# Altium schematic sheet P1.schdoc
size 297 x 209 mm; Symbol: Drawing-Symbol_A4; @Create Time: 13:52:45; @Update Time: 20:21:33; Border: 1; Width: 1170; Height: 825; Region Start: 1; X Region Count: 6; Y Region Count: 4; Blade Width: 10; Title Block Position: 3; Title Block: 1; @Board Name: ADC; Company: 嘉立创EDA; Version: V1.0; Page Size: A4; @Project Name: stm32f4; @Page Count: 1; @Update Date: 2025-11-17; @Create Date: 2025-11-02; @Schematic Name: Schematic2; @Page No: 1; @Page Name: P1; Device: Drawing-Symbol_A4
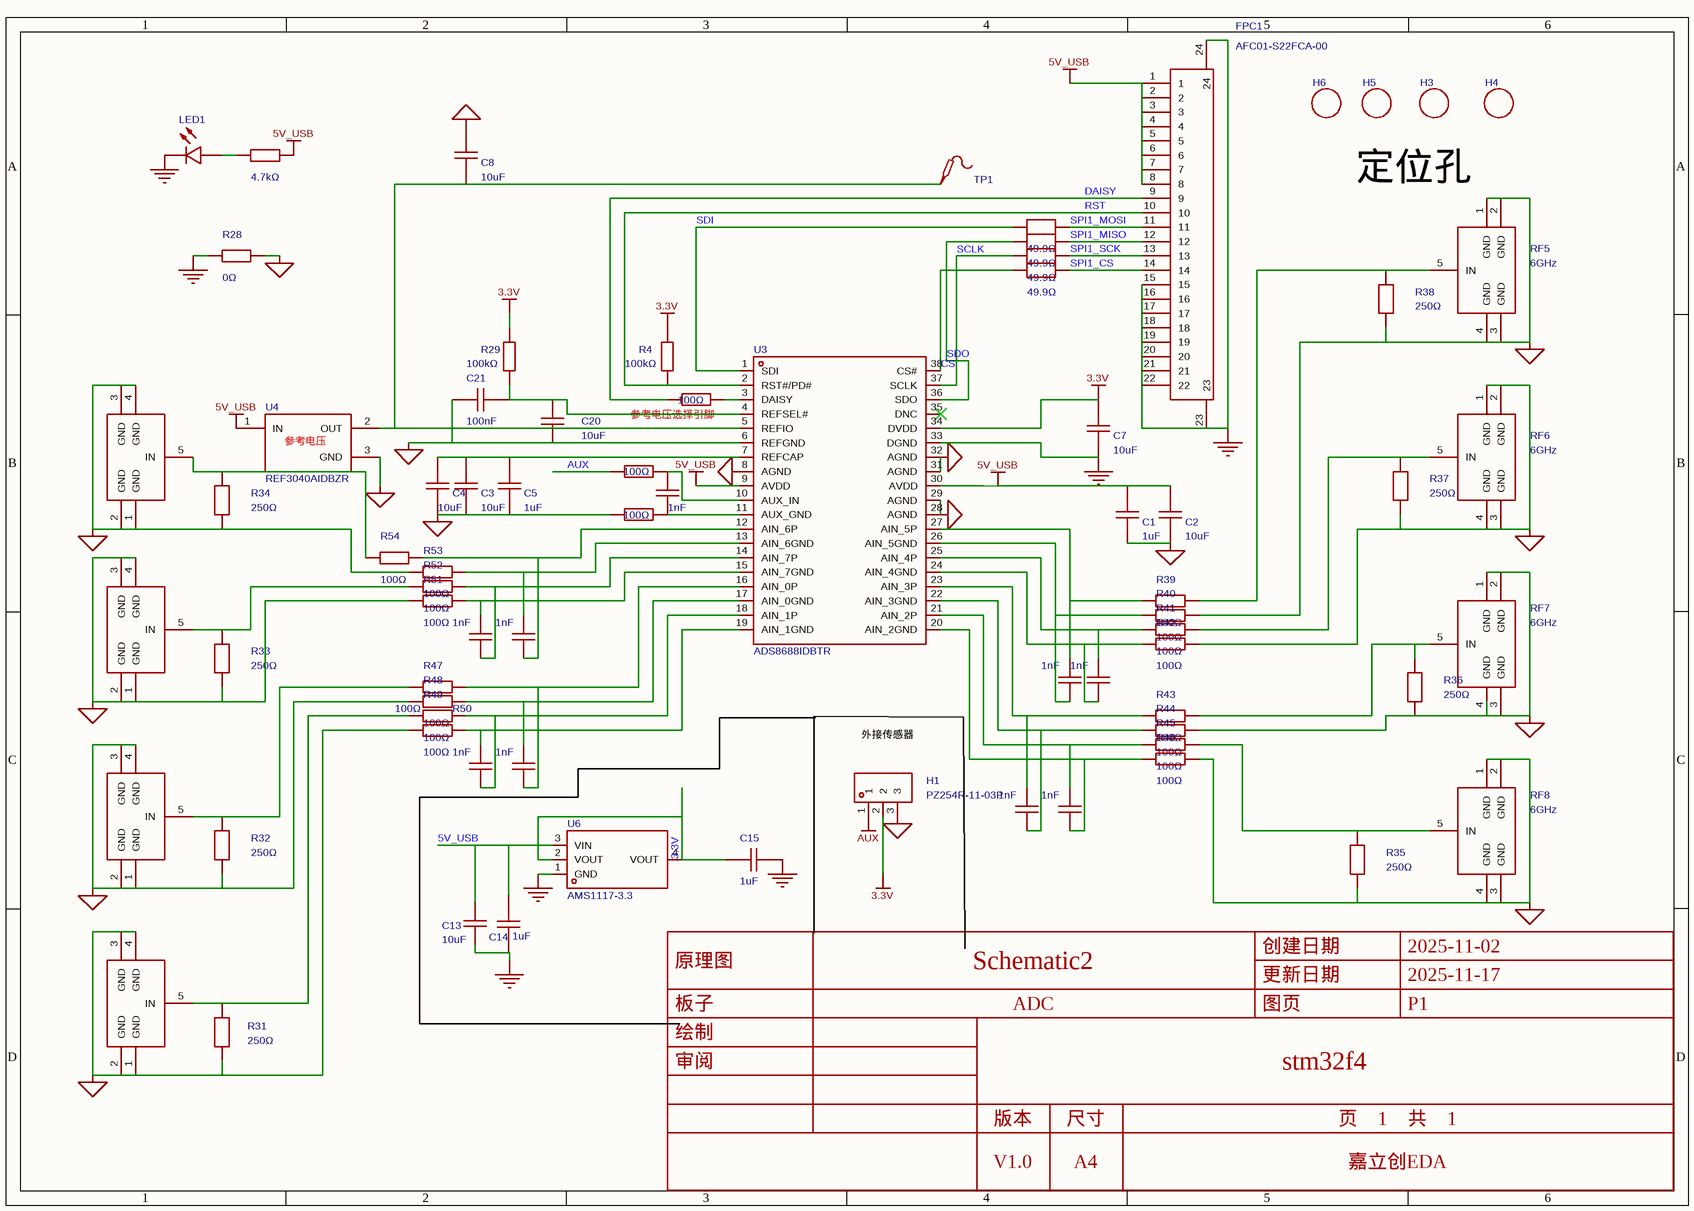
[diagram p0: P1.schdoc]

## Parts
C1  1uF  [C0603]
C2  10uF  [C0603]
C3  10uF  [C0603]
C4  10uF  [C0603]
C5  1uF  [C0603]
C6  1nF  [C0603]
C7  10uF  [C0603]
C8  10uF  [C0603]
C9  1nF  [C0603]
C10  1nF  [C0603]
C11  1nF  [C0603]
C12  1nF  [C0603]
C13  10uF  [C0603]
C14  1uF  [C0603]
C15  1uF  [C0603]
C16  1nF  [C0603]
C17  1nF  [C0603]
C18  1nF  [C0603]
C19  1nF  [C0603]
C20  10uF  [C0603]
C21  100nF  [C0402]
FPC1  AFC01-S22FCA-00  [FPC-SMD_P0.5-22P_FGS-XJ-H2.0]
H1  PZ254R-11-03P  [HDR-TH_3P-P2.54-H-M-W10.4]
H3  m3_3  [m3 125x300]  (value not drawn)
H4  m3_3  [m3 125x300]  (value not drawn)
H5  m3_3  [m3 125x300]  (value not drawn)
H6  m3_3  [m3 125x300]  (value not drawn)
LED1  19-217/R6C-AL1M2VY/3T  [LED0603-RD]  (value not drawn)
R1  100Ω  [R0603]
R3  100Ω  [R0603]
R4  100kΩ  [R0603]
R26  4.7kΩ  [R0402]
R28  0Ω  [R0603]
R29  100kΩ  [R0603]
R30  100Ω  [R0603]
R31  250Ω  [R1206]
R32  250Ω  [R1206]
R33  250Ω  [R1206]
R34  250Ω  [R1206]
R35  250Ω  [R1206]
R36  250Ω  [R1206]
R37  250Ω  [R1206]
R38  250Ω  [R1206]
R39  100Ω  [R0603]
R40  100Ω  [R0603]
R41  100Ω  [R0603]
R42  100Ω  [R0603]
R43  100Ω  [R0603]
R44  100Ω  [R0603]
R45  100Ω  [R0603]
R46  100Ω  [R0603]
R47  100Ω  [R0603]
R48  100Ω  [R0603]
R49  100Ω  [R0603]
R50  100Ω  [R0603]
R51  100Ω  [R0603]
R52  100Ω  [R0603]
R53  100Ω  [R0603]
R54  100Ω  [R0603]
R55  49.9Ω  [R0603]
R56  49.9Ω  [R0603]
R57  49.9Ω  [R0603]
R58  49.9Ω  [R0603]
RF1  6GHz  [ANT-TH_KH-SMA-K513-G]  (value not drawn)
RF2  6GHz  [ANT-TH_KH-SMA-K513-G]  (value not drawn)
RF3  6GHz  [ANT-TH_KH-SMA-K513-G]  (value not drawn)
RF4  6GHz  [ANT-TH_KH-SMA-K513-G]  (value not drawn)
RF5  6GHz  [ANT-TH_KH-SMA-K513-G]
RF6  6GHz  [ANT-TH_KH-SMA-K513-G]
RF7  6GHz  [ANT-TH_KH-SMA-K513-G]
RF8  6GHz  [ANT-TH_KH-SMA-K513-G]
TP1  (no value)  [Test-Point-0.5mm]
U3  ADS8688IDBTR  [TSSOP-38_L9.7-W4.4-P0.50-LS6.4-BL]
U4  REF3040AIDBZR  [SOT-23-3_L2.9-W1.6-P1.90-LS2.8-BR]
U6  AMS1117-3.3  [SOT-223-3_L6.5-W3.4-P2.30-LS7.0-BR]

## Nets
3.3V: C7.1 C15.1 H1.2 R4.2 R29.2 U3.34(DVDD) U6.2(VOUT) U6.4(VOUT)
5V_USB: C1.1 C2.1 C13.2 C14.2 FPC1.1 FPC1.2 FPC1.3 FPC1.4 FPC1.5 FPC1.6 FPC1.7 FPC1.8 R26.2 U3.9(AVDD) U3.30(AVDD) U4.1(IN) U6.3(VIN)
AGND: C1.2 C2.2 C3.1 C4.1 C5.2 C8.1 C20.2 C21.2 H1.3 R1.1 R28.2 R31.1 R32.1 R33.1 R34.1 R35.1 R36.1 R37.1 R38.2 R40.2 R42.2 R44.2 R46.2 R48.1 R50.1 R51.1 R53.1 RF1.1(GND) RF1.2(GND) RF1.3(GND) RF1.4(GND) RF2.1(GND) RF2.2(GND) RF2.3(GND) RF2.4(GND) RF3.1(GND) RF3.2(GND) RF3.3(GND) RF3.4(GND) RF4.1(GND) RF4.2(GND) RF4.3(GND) RF4.4(GND) RF5.1(GND) RF5.2(GND) RF5.3(GND) RF5.4(GND) RF6.1(GND) RF6.2(GND) RF6.3(GND) RF6.4(GND) RF7.1(GND) RF7.2(GND) RF7.3(GND) RF7.4(GND) RF8.1(GND) RF8.2(GND) RF8.3(GND) RF8.4(GND) U3.6(REFGND) U3.8(AGND) U3.28(AGND) U3.29(AGND) U3.31(AGND) U3.32(AGND) U4.3(GND)
AUX: H1.1 R30.1
GND: C7.2 C13.1 C14.1 C15.2 FPC1.15 FPC1.16 FPC1.17 FPC1.18 FPC1.19 FPC1.20 FPC1.21 FPC1.22 FPC1.23 FPC1.24 LED1.1(C) R28.1 U3.33(DGND) U6.1(GND)
CS: R58.1 U3.38(CS#)
DAISY: FPC1.9 R3.1
RST: FPC1.10 R4.1 U3.2(RST#/PD#)
SCLK: R57.1 U3.37(SCLK)
SDI: R55.1 U3.1(SDI)
SDO: R56.1 U3.36(SDO)
SPI1_CS: FPC1.14 R58.2
SPI1_MISO: FPC1.12 R56.2
SPI1_MOSI: FPC1.11 R55.2
SPI1_SCK: FPC1.13 R57.2
NetC3_2: C3.2 C4.2 C5.1 U3.7(REFCAP)
NetC6_1: C6.1 R1.2 U3.11(AUX_GND)
NetC6_2: C6.2 R30.2 U3.10(AUX_IN)
NetC8_2: C8.2 TP1.1 U3.5(REFIO) U4.2(OUT)
NetC9_1: C9.1 R51.2 U3.15(AIN_7GND)
NetC9_2: C9.2 R52.2 U3.14(AIN_7P)
NetC10_1: C10.1 R53.2 U3.13(AIN_6GND)
NetC10_2: C10.2 R54.2 U3.12(AIN_6P)
NetC11_1: C11.1 R50.2 U3.19(AIN_1GND)
NetC11_2: C11.2 R49.2 U3.18(AIN_1P)
NetC12_1: C12.1 R48.2 U3.17(AIN_0GND)
NetC12_2: C12.2 R47.2 U3.16(AIN_0P)
NetC16_1: C16.1 R43.1 U3.23(AIN_3P)
NetC16_2: C16.2 R44.1 U3.22(AIN_3GND)
NetC17_1: C17.1 R45.1 U3.21(AIN_2P)
NetC17_2: C17.2 R46.1 U3.20(AIN_2GND)
NetC18_1: C18.1 R41.1 U3.25(AIN_4P)
NetC18_2: C18.2 R42.1 U3.24(AIN_4GND)
NetC19_1: C19.1 R39.1 U3.27(AIN_5P)
NetC19_2: C19.2 R40.1 U3.26(AIN_5GND)
NetC20_1: C20.1 C21.1 R29.1 U3.4(REFSEL#)
NetLED1_2: LED1.2(A) R26.1
NetR3_2: R3.2 U3.3(DAISY)
NetR31_2: R31.2 R49.1 RF4.5(IN)
NetR32_2: R32.2 R47.1 RF3.5(IN)
NetR33_2: R33.2 R52.1 RF2.5(IN)
NetR34_2: R34.2 R54.1 RF1.5(IN)
NetR35_2: R35.2 R45.2 RF8.5(IN)
NetR36_2: R36.2 R43.2 RF7.5(IN)
NetR37_2: R37.2 R41.2 RF6.5(IN)
NetR38_1: R38.1 R39.2 RF5.5(IN)

Not connected (* = marked no-connect by the designer): U3 35(DNC)*

## Notes on the sheet
- 定位孔
- (near U4) 参考电压
- (near R3) 参考电压选择引脚
- 外接传感器
- 创建日期
- 2025-11-02
- 原理图
- 板子
- Schematic2
- ADC
- 更新日期
- 图页
- 2025-11-17
- P1
- 绘制
- 审阅
- stm32f4
- 版本
- V1.0
- 尺寸
- A4
- 页    1    共    1
- 嘉立创EDA

## Library data of the parts
C1 C5 C14 C15 = CL10A105KB8NNNC: 容值:1uF;精度:±10%;额定电压:50V;温度系数:X5R;; Manufacturer: SAMSUNG(三星); AddInBom: yes; ModelId: ac125912035d415993ca9572d50418b1; ModelName: C0603_L1.6-W0.8-H0.8; ModelTransform: 62.992,31.496,0,0,0,0,0,0,0; Tolerance: ±10%; Voltage Rating: 50V; Temperature Coefficient: X5R; Symbol: CL10A105KB8NNNC; Device: CL10A105KB8NNNC; LCSC Part Name: 1uF ±10% 50V; SupplierPart: C15849; ManufacturerPart: CL10A105KB8NNNC; Supplier Footprint: 0603; JLCPCB Part Class: 基础库; Datasheet: https://item.szlcsc.com/datasheet/CL10A105KB8NNNC/16531.html; Supplier: LCSC; ConvertToPcb: yes; FootprintName: C0603; Value: 1uF
C2-C4 C7 C8 = 0603X106M250NT: 容值:10uF;精度:±20%;额定电压:25V;温度系数:X5R;; Manufacturer: FH(风华); AddInBom: yes; ModelId: ac125912035d415993ca9572d50418b1; ModelName: C0603_L1.6-W0.8-H0.8; ModelTransform: 62.992,31.496,0,0,0,0,0,0,0; Tolerance: ±20%; Voltage Rating: 25V; Temperature Coefficient: X5R; Symbol: 0603X106M250NT; Device: 0603X106M250NT; LCSC Part Name: 10uF ±20% 25V; SupplierPart: C479655; ManufacturerPart: 0603X106M250NT; Supplier Footprint: 0603; JLCPCB Part Class: 扩展库; Datasheet: https://atta.szlcsc.com/upload/public/pdf/source/20200305/C486355_26A10D38EF8C2A5C37091D0039909270.pdf; Supplier: LCSC; ConvertToPcb: yes; FootprintName: C0603; Value: 10uF
C6 C9-C12 C16-C19 = CL10B102KB8NNNC: 容值:1nF;精度:±10%;额定电压:50V;温度系数:X7R;; Manufacturer: SAMSUNG(三星); AddInBom: yes; ModelId: ac125912035d415993ca9572d50418b1; ModelName: C0603_L1.6-W0.8-H0.8; ModelTransform: 62.992,31.496,0,0,0,0,0,0,0; Tolerance: ±10%; Voltage Rating: 50V; Temperature Coefficient: X7R; Symbol: CL10B102KB8NNNC; Device: CL10B102KB8NNNC; LCSC Part Name: 1nF ±10% 50V; SupplierPart: C1588; ManufacturerPart: CL10B102KB8NNNC; Supplier Footprint: 0603; JLCPCB Part Class: 基础库; Datasheet: https://item.szlcsc.com/datasheet/CL10B102KB8NNNC/1940.html; Supplier: LCSC; ConvertToPcb: yes; FootprintName: C0603; Value: 1nF
C13 C20 = 0603X106K100NT: 容值:10uF;精度:±10%;额定电压:10V;材质(温度系数):X5R;; Manufacturer: FH(风华); AddInBom: yes; ModelId: ac125912035d415993ca9572d50418b1; ModelName: C0603_L1.6-W0.8-H0.8; ModelTransform: 62.992,31.496,0,0,0,0,0,0,0; Tolerance: ±10%; Voltage Rated: 10V; Temperature Coefficient: X5R; Device: 0603X106K100NT; Symbol: 0603X106K100NT; LCSC Part Name: 10uF ±10% 10V; SupplierPart: C38898; ManufacturerPart: 0603X106K100NT; Supplier Footprint: 0603; Datasheet: https://atta.szlcsc.com/upload/public/pdf/source/20170923/C38898_1506149449306988751.pdf; Supplier: LCSC; ConvertToPcb: yes; FootprintName: C0603; Value: 10uF
C21 = CC0402KRX7R7BB104: 容值:100nF;精度:±10%;额定电压:16V;材质(温度系数):X7R;; Manufacturer: YAGEO(国巨); AddInBom: yes; ModelId: 36a51122f27c49738f86b3bfa98863e0; ModelName: C0402_L1.0-W0.5-H0.5; ModelTransform: 39.37,19.685,0,0,0,0,0,0,0; Tolerance: ±10%; Voltage Rated: 16V; Temperature Coefficient: X7R; Device: CC0402KRX7R7BB104; Symbol: CC0402KRX7R7BB104; LCSC Part Name: 100nF ±10% 16V; SupplierPart: C60474; ManufacturerPart: CC0402KRX7R7BB104; Supplier Footprint: 0402; Datasheet: https://atta.szlcsc.com/upload/public/pdf/source/20211223/9278FD768280B81DDBEF48FA36411A03.pdf; Supplier: LCSC; ConvertToPcb: yes; FootprintName: C0402; Value: 100nF
FPC1 = AFC01-S22FCA-00: 锁定特性:翻盖式;触点类型:下接;触点数量:22P;间距:0.5mm;安装类型:卧贴;; Manufacturer: JS(钜硕电子); AddInBom: yes; ModelId: 12d9165dec84425d968f174b1be8289a; ModelTransform: 610.235,240.157,0,0,0,0,0,57.008,0; Locking Feature: 翻盖式; Number of Contacts: 22P; Pitch: 0.5mm; FFC, FCB Thickness: 0.3mm; Symbol: AFC01-S22FCA-00; Device: AFC01-S22FCA-00; LCSC Part Name: 间距:0.5mm P数:22P 翻盖式 下接; SupplierPart: C262668; ManufacturerPart: AFC01-S22FCA-00; Supplier Footprint: SMD,P=0.5mm,卧贴; JLCPCB Part Class: 扩展库; Datasheet: https://atta.szlcsc.com/upload/public/pdf/source/20190816/C413942_2A72D1AC756EAE17EEDF756A339D4500.pdf; Supplier: LCSC; ConvertToPcb: yes; FootprintName: FPC-SMD_P0.5-22P_FGS-XJ-H2.0; ModelName: FPC-SMD_P0.5-22P_FGS-XJ-H2.0; Contact Type: 下接; Mounting Type: 卧贴; Height Above Board: 2mm
H1 = PZ254R-11-03P: 插针结构:1x3P;间距:2.54mm;行距:-;圆针/方针:方针;安装方式:弯插;排数:单排;总PIN位数:3P;额定电流:-;额定电压:-;配合针长度:6mm;塑高:2.5mm;触头材质:黄铜;触头镀层:-;工作温度:-40℃~+105℃;颜色:黑色;; Manufacturer: XFCN(兴飞); AddInBom: yes; ModelId: 3631fb14048f41fcbbc4081ca5f7f71f; ModelName: HDR-TH_3P-P2.54-M-WI-1X3P; ModelTransform: 299.9994,409.448,0,0,0,0,0,-190.945,-118.11; Pin Structure: 1x3P; Pitch: 2.54mm; Circluar Pins/Square Pins: 方针; Symbol: PZ254R-11-03P; Device: PZ254R-11-03P; LCSC Part Name: 1x3P 间距:2.54mm 方针 弯插; SupplierPart: C492411; ManufacturerPart: PZ254R-11-03P; Supplier Footprint: 弯插,P=2.54mm; JLCPCB Part Class: 扩展库; Datasheet: https://item.szlcsc.com/datasheet/PZ254R-11-03P/502967.html; Supplier: LCSC; ConvertToPcb: yes; FootprintName: HDR-TH_3P-P2.54-H-M-W10.4; Row Spacing: -; Mounting Type: 弯插; Number of Rows: 单排; Number of Pins: 3P; Current Rating: -; Voltage Rating (Max): -; Length of Mating Pin: 6mm; Insulation Height: 2.5mm; Contact Material: 黄铜; Contact Plating: -; Operating Temperature: -40℃~+105℃; Color: 黑色
H3-H6 = m3_3: Symbol: m3; AddInBom: yes; Device: m3_3; ConvertToPcb: yes; FootprintName: m3 125x300
LED1 = 19-217/R6C-AL1M2VY/3T: 发光颜色:红色;正向压降(Vf):1.95V;功率:60mW;正向电流:5mA;波长:617.5nm;二极管配置:-;透镜颜色:无色透明透镜;色温:-;发光角度:120°;载带方式:-;工作温度:-40℃~+85℃;; Manufacturer: EVERLIGHT(亿光); AddInBom: yes; ModelId: 1f0d29a91be547639d425604e9b96ebb; ModelTransform: 63.7794,32.283,0,0,0,0,0,0,0; Illumination Color: 红色; Voltage - Forward(Vf): 1.95V; Power(Watts): 60mW; Forward Current: 5mA; Peak Wavelength: 632nm; Lens Color: 无色透明透镜; Viewing Angle: 120°; Symbol: 19-217/R6C-AL1M2VY/3T; Device: 19-217/R6C-AL1M2VY/3T; LCSC Part Name: 红灯 停产; SupplierPart: C72044; ManufacturerPart: 19-217/R6C-AL1M2VY/3T; Supplier Footprint: 0603; JLCPCB Part Class: 扩展库; Supplier: LCSC; ConvertToPcb: yes; FootprintName: LED0603-RD; ModelName: LED0603-RD; Wavelength - Dominant: 617.5nm; Diode Configuration: -; Color Temperature: -; Mounting Style: -; Operating Temperature: -40℃~+85℃
R1 R3 R30 R39-R54 = 0603WAF1000T5E: 电阻类型:厚膜电阻;阻值:100Ω;精度:±1%;功率:100mW;最大工作电压:75V;温度系数:±200ppm/℃;; Manufacturer: UNI-ROYAL(厚声); AddInBom: yes; ModelId: fc143cca1e79419f9cd78b61e9279f08; ModelTransform: 31.8897,63.7794,0,90,0,0,0,0,0; Tolerance: ±1%; Power(Watts): 100mW; Overload Voltage (Max): 75V; Symbol: 0603WAF1000T5E; Device: 0603WAF1000T5E; LCSC Part Name: 100Ω ±1% 100mW 厚膜电阻; SupplierPart: C22775; ManufacturerPart: 0603WAF1000T5E; Supplier Footprint: 0603; JLCPCB Part Class: 基础库; Datasheet: https://atta.szlcsc.com/upload/public/pdf/source/20200306/C422600_1E6D84923E4A46A82E41ADD87F860B5C.pdf; Supplier: LCSC; ConvertToPcb: yes; FootprintName: R0603; ModelName: R0603; Type: 厚膜电阻; Value: 100Ω; Temperature Coefficient: ±200ppm/℃; Operating Temperature Range: -55℃~+155℃
R4 R29 = 0603WAF1003T5E: 电阻类型:厚膜电阻;阻值:100kΩ;精度:±1%;功率:100mW;工作电压:75V;温度系数:±100ppm/℃;; Manufacturer: UNI-ROYAL(厚声); AddInBom: yes; ModelId: fc143cca1e79419f9cd78b61e9279f08; ModelTransform: 31.8897,63.7794,0,90,0,0,0,0,0; Tolerance: ±1%; Power(Watts): 100mW; Voltage-Supply(Max): 75V; Symbol: 0603WAF1003T5E; Device: 0603WAF1003T5E; LCSC Part Name: 100kΩ ±1% 100mW 厚膜电阻; SupplierPart: C25803; ManufacturerPart: 0603WAF1003T5E; Supplier Footprint: 0603; JLCPCB Part Class: 基础库; Datasheet: https://item.szlcsc.com/datasheet/0603WAF1003T5E/26546.html; Supplier: LCSC; ConvertToPcb: yes; FootprintName: R0603; ModelName: R0603; Type: 厚膜电阻; Value: 100kΩ; Temperature Coefficient: ±100ppm/℃; Operating Temperature: -55℃~+155℃
R26 = 0402WGF4701TCE: 电阻类型:厚膜电阻;阻值:4.7kΩ;精度:±1%;功率:62.5mW;工作电压:50V;温度系数:±100ppm/℃;; Manufacturer: UNI-ROYAL(厚声); AddInBom: yes; ModelId: 98c88bc2b9094f218f3a3e30a7012738; ModelName: R0402_L1.0-W0.5-H0.4; ModelTransform: 39.37,19.685,0,0,0,0,0,0,0; Tolerance: ±1%; Power(Watts): 62.5mW; Voltage-Supply(Max): 50V; Symbol: 0402WGF4701TCE; Device: 0402WGF4701TCE; LCSC Part Name: 4.7kΩ ±1% 62.5mW 厚膜电阻; SupplierPart: C25900; ManufacturerPart: 0402WGF4701TCE; Supplier Footprint: 0402; JLCPCB Part Class: 基础库; Datasheet: https://item.szlcsc.com/datasheet/0402WGF4701TCE/26643.html; Supplier: LCSC; ConvertToPcb: yes; FootprintName: R0402; Type: 厚膜电阻; Value: 4.7kΩ; Temperature Coefficient: ±100ppm/℃; Operating Temperature: -55℃~+155℃
R28 = 0603WAF0000T5E: 电阻类型:厚膜电阻;阻值:0Ω;精度:±1%;功率:100mW;工作电压:75V;温度系数:-;; Manufacturer: UNI-ROYAL(厚声); AddInBom: yes; ModelId: fc143cca1e79419f9cd78b61e9279f08; ModelTransform: 31.8897,63.7794,0,90,0,0,0,0,0; Tolerance: ±1%; Power(Watts): 100mW; Voltage-Supply(Max): 75V; Symbol: 0603WAF0000T5E; Device: 0603WAF0000T5E; LCSC Part Name: 0Ω ±1% 100mW 厚膜电阻; SupplierPart: C21189; ManufacturerPart: 0603WAF0000T5E; Supplier Footprint: 0603; JLCPCB Part Class: 基础库; Datasheet: https://item.szlcsc.com/datasheet/0603WAF0000T5E/21903.html; Supplier: LCSC; ConvertToPcb: yes; FootprintName: R0603; ModelName: R0603; Type: 厚膜电阻; Value: 0Ω; Temperature Coefficient: -; Operating Temperature: -55℃~+155℃
R31-R38 = PTFR1206B250RP9: 电阻类型:薄膜电阻;阻值:250Ω;精度:±0.1%;功率:250mW;工作电压:200V;温度系数:±25ppm/℃;; Manufacturer: RESI(开步睿思); AddInBom: yes; ModelId: 89a1f13db2384da588040e0b3c55bf66; ModelName: R1206_L3.2-W1.6-H0.6; ModelTransform: 125.984,62.992,0,0,0,0,0,0,0; Tolerance: ±0.1%; Power(Watts): 250mW; Voltage-Supply(Max): 200V; Symbol: PTFR1206B250RP9; Device: PTFR1206B250RP9; LCSC Part Name: 薄膜电阻 250Ω ±0.1% 250mW; SupplierPart: C5382602; ManufacturerPart: PTFR1206B250RP9; Supplier Footprint: 1206; JLCPCB Part Class: 扩展库; Datasheet: https://item.szlcsc.com/datasheet/PTFR1206B250RP9/6255137.html; Supplier: LCSC; ConvertToPcb: yes; FootprintName: R1206; Type: 薄膜电阻; Value: 250Ω; Temperature Coefficient: ±25ppm/℃; Operating Temperature: -55℃~+155℃
R55-R58 = FRC0603F49R9TS: 电阻类型:厚膜电阻;阻值:49.9Ω;精度:±1%;功率:100mW;工作电压:75V;温度系数:±100ppm/℃;; Manufacturer: FOJAN(富捷); AddInBom: yes; ModelId: fc143cca1e79419f9cd78b61e9279f08; ModelTransform: 31.8897,63.7794,0,90,0,0,0,0,0; Tolerance: ±1%; Power(Watts): 100mW; Voltage-Supply(Max): 75V; Symbol: FRC0603F49R9TS; Device: FRC0603F49R9TS; LCSC Part Name: 49.9Ω ±1% 100mW 厚膜电阻; SupplierPart: C2930110; ManufacturerPart: FRC0603F49R9TS; Supplier Footprint: 0603; JLCPCB Part Class: 扩展库; Supplier: LCSC; ConvertToPcb: yes; FootprintName: R0603; ModelName: R0603; Type: 厚膜电阻; Value: 49.9Ω; Temperature Coefficient: ±100ppm/℃; Operating Temperature: -55℃~+155℃
RF1-RF8 = KH-SMA-K513-G: 连接器类型:板端;接口类型:内孔;端口数量:1;接口直径:-;接口长度/高度:-;频率:6GHz;射频系列:SMA;阻抗:50Ω;样式:弯头;工作温度:-55℃~+155℃;; Manufacturer: kinghelm(金航标); AddInBom: yes; ModelId: d7d2010d82e6431cb2146b4719b2209b; ModelName: ANT-TH_L14.8-W6.4-H10.0; ModelTransform: 582.676,249.9995,0,0,0,0,-169.291,0,-137.795; Connector Type: 板端; Interface: 内孔; Number of Ports: 1; RF Series: SMA; Impedance: 50Ω; Style: 弯头; Symbol: KH-SMA-K513-G; Device: KH-SMA-K513-G; LCSC Part Name: SMA 内孔 弯头; SupplierPart: C411575; ManufacturerPart: KH-SMA-K513-G; Supplier Footprint: 插件; JLCPCB Part Class: 扩展库; Datasheet: https://item.szlcsc.com/datasheet/KH-SMA-K513-G/402832.html; Supplier: LCSC; ConvertToPcb: yes; FootprintName: ANT-TH_KH-SMA-K513-G; Interface Diameter: -; Interface Length/Height: -; Value: 6GHz; Operating Temperature Range: -55℃~+155℃
TP1 = Test-Point: Test Point 测试点; AddInBom: yes; Device: Test-Point; ConvertToPcb: yes; SymbolName: Test-Point; FootprintName: Test-Point-0.5mm
U3 = ADS8688IDBTR: 分辨率:16位;采样率:500kHz;工作电压:5V;接口类型:SPI;; Manufacturer: TI(德州仪器); AddInBom: yes; ModelId: 6fc8ae0b31e54feeb05b0ccf963847a5; ModelName: TSSOP-38_L9.7-W4.4-H1.0-LS6.4-P0.50; ModelTransform: 381.889,251.968,0,0,0,0,0,0,0; Resolution(Bits): 16位; Sampling Rate: 500kHz; number of channels: 8; Voltage - Supply: 5V; Interface: SPI; differential input: 否; Integral non - linearity: 0.75LSB; Signal-to-Noise Ratio: 92dB; Clock Frequency: 17MHz; Voltage Reference: 内置; Voltage Reference Drift: 6ppm/℃; ADC architecture: SAR; Full-Scale Range(FSR): 10.24V; Symbol: ADS8688IDBTR; Device: ADS8688IDBTR; LCSC Part Name: 具有双极性输入范围的单电源、16bit 、500 kSPS、4通道和8通道SAR（SAR）ADC; SupplierPart: C527390; ManufacturerPart: ADS8688IDBTR; Supplier Footprint: TSSOP-38-4.4mm; JLCPCB Part Class: 扩展库; Datasheet: https://www.ti.com/cn/lit/gpn/ads8684; Supplier: LCSC; ConvertToPcb: yes; FootprintName: TSSOP-38_L9.7-W4.4-P0.50-LS6.4-BL; Operating Temperature: -40℃~+125℃
U4 = REF3040AIDBZR: REF3040 采用 SOT23-3 封装的 4.096V 输出 50ppm/℃ 漂移 50uA 静态电流的（带隙）电压参考系列; Manufacturer: TI(德州仪器); AddInBom: yes; ModelId: 89cb27a44ab2466697082bb9fd73a7d0; ModelName: SOT-23-3L_L2.9-W1.6-H1.1-LS2.8-P0.95; ModelTransform: 110.236,114.173,0,180,0,0,-0.005,0.0005,0; Device: REF3040AIDBZR; Symbol: REF3040AIDBZR; LCSC Part Name: REF3040AIDBZR; SupplierPart: C19415; ManufacturerPart: REF3040AIDBZR; Supplier Footprint: SOT-23(SOT-23-3); JLCPCB Part Class: Extended Part; Datasheet: https://atta.szlcsc.com/upload/public/pdf/source/20130925/1457706650762.pdf; Supplier: LCSC; ConvertToPcb: yes; FootprintName: SOT-23-3_L2.9-W1.6-P1.90-LS2.8-BR
U6 = AMS1117-3.3_C6186: 输出类型:固定;工作电压:16V;输出电压:3.3V;输出电流:1A;电源纹波抑制比(PSRR):72dB@(120Hz);输出极性:正极;; Manufacturer: AMS; AddInBom: yes; ModelId: 925194bf9823436183a3e0b978a8d076; ModelName: SOT-223-4P_L6.5-W3.5-H1.6-LS7.0-P2.30; ModelTransform: 279.89794,255.905,0,180,0,0,-3.9385,-0.0005,0; Output Type: 固定; Voltage - Supply: 16V; Output Voltage: 3.3V; Output Current: 1A; Voltage Dropout: 1.1V@(800mA); standby current: 5mA; Noise: 0.003%Vout; Output Configuration: 正极; Number of Outputs: 1; Symbol: AMS1117-3.3; Device: AMS1117-3.3_C6186; LCSC Part Name: 输出3.3V 1A; SupplierPart: C6186; ManufacturerPart: AMS1117-3.3; Supplier Footprint: SOT-223; JLCPCB Part Class: 基础库; Datasheet: https://item.szlcsc.com/datasheet/AMS1117-3.3/6652.html; Supplier: LCSC; ConvertToPcb: yes; FootprintName: SOT-223-3_L6.5-W3.4-P2.30-LS7.0-BR; Power Supply Rejection Ratio (PSRR): 72dB@(120Hz); Features: 过流保护；过热保护; Operating Temperature: -40℃~+125℃